# Altium project Interface-Board-v4.0.PrjPcb (part 1 of 2)
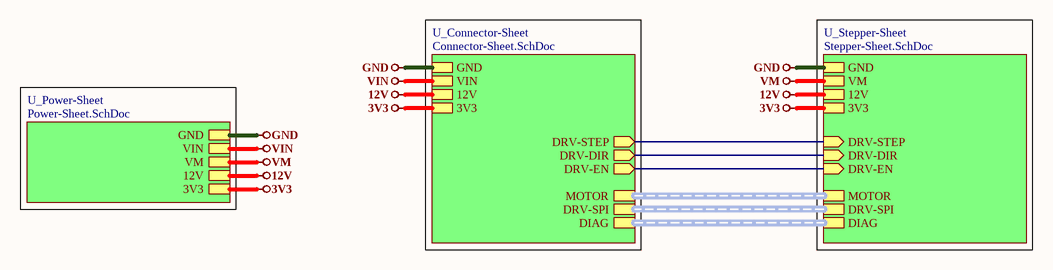
[diagram p0: Top-Sheet.SchDoc]
4 sheets, 98 parts. Net scope: hierarchical (ports join the sheet entries above them; power ports are global).
Board file: Interface-Board-v4.0.PcbDoc
Sheets:
  Top-Sheet.SchDoc
    U_Power-Sheet = Power-Sheet.SchDoc
    U_Stepper-Sheet = Stepper-Sheet.SchDoc
    U_Connector-Sheet = Connector-Sheet.SchDoc

## Sheet Top-Sheet.SchDoc
size A4; SheetNumber: 1; SheetTotal: 4

### Sub-sheets
U_Connector-Sheet = Connector-Sheet.SchDoc: GND, 3V3, 12V, VIN, MOTOR (harness MOTOR), DRV-SPI (harness DRV-SPI), DIAG (harness DIAG), DRV-STEP (out), DRV-DIR (out), DRV-EN (out)
U_Power-Sheet = Power-Sheet.SchDoc: GND, 3V3, 12V, VM, VIN
U_Stepper-Sheet = Stepper-Sheet.SchDoc: GND, 3V3, 12V, VM, MOTOR (harness MOTOR), DRV-SPI (harness DRV-SPI), DIAG (harness DIAG), DRV-STEP (in), DRV-DIR (in), DRV-EN (in)

### Nets
3V3: sheet U_Power-Sheet/3V3, sheet U_Stepper-Sheet/3V3, sheet U_Connector-Sheet/3V3
12V: sheet U_Power-Sheet/12V, sheet U_Stepper-Sheet/12V, sheet U_Connector-Sheet/12V
GND: sheet U_Power-Sheet/GND, sheet U_Stepper-Sheet/GND, sheet U_Connector-Sheet/GND
VIN: sheet U_Power-Sheet/VIN, sheet U_Connector-Sheet/VIN
VM: sheet U_Power-Sheet/VM, sheet U_Stepper-Sheet/VM
DRV-DIR: sheet U_Stepper-Sheet/DRV-DIR, sheet U_Connector-Sheet/DRV-DIR
DRV-EN: sheet U_Stepper-Sheet/DRV-EN, sheet U_Connector-Sheet/DRV-EN
DRV-STEP: sheet U_Stepper-Sheet/DRV-STEP, sheet U_Connector-Sheet/DRV-STEP

### Buses and harness runs
harness sheet U_Connector-Sheet/DIAG = sheet U_Stepper-Sheet/DIAG
harness sheet U_Connector-Sheet/DRV-SPI = sheet U_Stepper-Sheet/DRV-SPI
harness sheet U_Connector-Sheet/MOTOR = sheet U_Stepper-Sheet/MOTOR

### Notes on the sheet
- File:
- Title:
- Date:
- Page
- Num:
- Total:
- Drawn By: Huzaifa Ali

## Sheet Power-Sheet.SchDoc
size A4; SheetNumber: 2; SheetTotal: 4
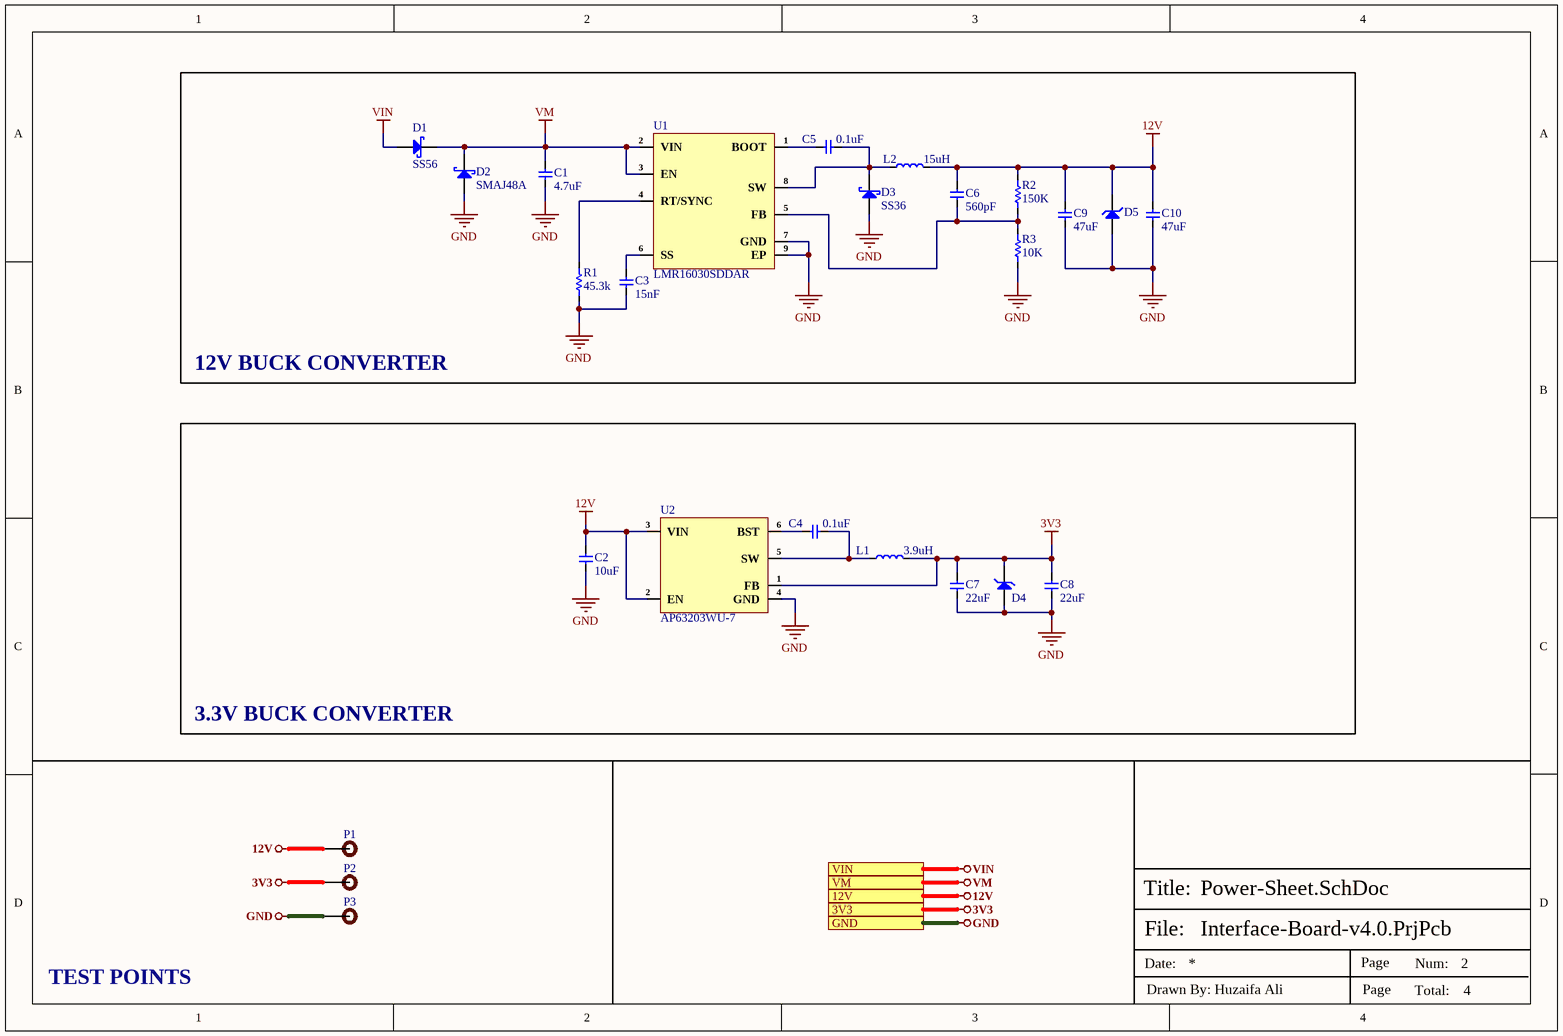
[diagram p1: Power-Sheet.SchDoc]

### Parts
C1  4.7uF  [Cap-1206]
C2  10uF  [Cap-0805]
C3  15nF  [Cap-0402]
C4  0.1uF  [Cap-0402]
C5  0.1uF  [Cap-0402]
C6  560pF  [Cap-0402]
C7  22uF  [Cap-0805]
C8  22uF  [Cap-0805]
C9  47uF  [Cap-1210]
C10  47uF  [Cap-1210]
D1  SS56  [SMA]
D2  SMAJ48A  [SMA]
D3  SS36  [SMA]
D4  MSP3V3HM3/89A  [MicroSMP]  (value not drawn)
D5  MSMP12A-M3/89A  [MicroSMP]  (value not drawn)
L1  3.9uH  [FNR4030S3R9MT]
L2  15uH  [FEXL0550A-150M]
P1  TEST POINT 0.5mm Dia  [Test-point - 0.5mm]  (value not drawn)
P2  TEST POINT 0.5mm Dia  [Test-point - 0.5mm]  (value not drawn)
P3  TEST POINT 0.5mm Dia  [Test-point - 0.5mm]  (value not drawn)
R1  45.3k  [Res-0402]
R2  150K  [Res-0402]
R3  10K  [Res-0402]
U1  LMR16030SDDAR  [8-SO-EP_]
U2  AP63203WU-7  [TSOT-23-6]

### Blocks framed on the sheet
12V BUCK CONVERTER: C1 C3 C5 C6 C9 C10 D1-D3 D5 L2 R1-R3 U1
3.3V BUCK CONVERTER: C2 C4 C7 C8 D4 L1 U2

### Ports
3V3 (see Top-Sheet[2B], Connector-Sheet[3D], Stepper-Sheet[3D]), 12V (see Top-Sheet[2B], Connector-Sheet[3D], Stepper-Sheet[3D]), GND (see Top-Sheet[2B], Connector-Sheet[3D], Stepper-Sheet[3D]), VIN (see Top-Sheet[2B], Connector-Sheet[3D]), VM (see Top-Sheet[2B], Stepper-Sheet[3D])

### Nets
3V3: C7.2 C8.2 D4.2(K) L1.2 P2.1 U2.1(FB) ; port 3V3
12V: C2.2 C6.2 C9.2 C10.2 D5.2(K) L2.2 P1.1 R2.2 U2.2(EN) U2.3(VIN) ; port 12V
GND: C1.1 C2.1 C3.1 C7.1 C8.1 C9.1 C10.1 D2.2(A) D3.2(A) D4.1(A) D5.1(A) P3.1 R1.1 R3.1 U1.7(GND) U1.9(EP) U2.4(GND) ; port GND
VIN: D1.2(A) ; port VIN
VM: C1.2 D1.1(K) D2.1(K) U1.2(VIN) U1.3(EN) ; port VM
NetC3_2: C3.2 U1.6(SS)
NetC4_1: C4.1 U2.6(BST)
NetC4_2: C4.2 L1.1 U2.5(SW)
NetC5_1: C5.1 U1.1(BOOT)
NetC5_2: C5.2 D3.1(K) L2.1 U1.8(SW)
NetC6_1: C6.1 R2.1 R3.2 U1.5(FB)
NetR1_2: R1.2 U1.4(RT/SYNC)

### Notes on the sheet
- TEST POINTS
- File:
- Title:
- Date:
- Page
- Num:
- Total:
- Drawn By: Huzaifa Ali

### Library data of the parts
C1 = GRM31CZ72A475KE11L: CAP CER, 4.7 uF, 100 V, ± 10%, X7R, 1206 [3216 Metric]; Manufacturer: Murata; Material: 4241ConductorMaterial; Voltage Rating: 100V; Item Type: Capacitor; Supplier: Digi-Key; Supplier Part Number: 490-GRM31CZ72A475KE11LCT-ND; Manufacturer Part Number: GRM31CZ72A475KE11L; RoHS: Yes; Category: Ceramic Capacitors; Stock: 152; Pricing: 1=0.76, 10=0.53, 50=0.4462, 100=0.3633, 500=0.30274, 1000=0.25495 (USD); Case/Package: 340Case; Min Operating Temperature: -55°C; Max Operating Temperature: 125°C; Value: 4.7uF; Tolerance: 10%; Length: 3.2mm; Width: 1.6mm; Height: 1.9mm; Thickness: 1.6mm; RoHS Compliant: Yes; LCSC Part Number: C2997285; ComponentLink1Description: LCSC; ComponentLink1URL: https://www.lcsc.com/product-detail/Multilayer-Ceramic-Capacitors-MLCC-SMD-SMT_Murata-Electronics-GRM31CZ72A475KE11L_C2997285.html
C2 = CL21B106KAYQNNE: 25V 10uF X7R ±10% 0805 Multilayer Ceramic Capacitors MLCC - SMD/SMT ROHS; Manufacturer: Samsung Electro-Mechanics; Manufacturer Part Number: CL21B106KAYQNNE; Package: 0805; LCSC Part Number: C3039694; Item Type: Capacitor; ComponentLink1Description: LCSC; ComponentLink1URL: https://www.lcsc.com/product-detail/Multilayer-Ceramic-Capacitors-MLCC-SMD-SMT_Samsung-Electro-Mechanics-CL21B106KAYQNNE_C3039694.html
C3 = CC0402KRX7R9BB153: CAP CER 0.015UF 50V X7R 0402; Manufacturer: Yageo; Tolerance: 10%; Item Type: Capacitor; Supplier: Future Electronics; Supplier Part Number: 1105976; Manufacturer Part Number: CC0402KRX7R9BB153; RoHS: Yes; Category: Ceramic Capacitors; Stock: 10000; Pricing: 10000=0.0032, 40000=0.0031, 150000=0.0029, 250000=0.0028, 500000=0.0027 (USD); Mounting Technology: Surface Mount; Case/Package: 0402; Min Operating Temperature: -55°C; Max Operating Temperature: 125°C; Packaging: Tape and Reel; Value: 15nF; Voltage Rating: 50V; Voltage Rating (DC): 50V; Dielectric: X7R; Series: CC; Length: 0.039inch; Width: 0.02inch; Thickness: 0.022inch; Lead Free: Lead Free; Halogen Free: Halogen Free; RoHS Compliant: Yes; ComponentLink1URL: https://datasheet.octopart.com/CC0402KRX7R9BB153-Yageo-datasheet-166511530.pdf?src-supplier=Future+Electronics; ComponentLink1Description: https://datasheet.octopart.com/CC0402KRX7R9BB153-Yageo-datasheet-166511530.pdf?src-supplier=Future+Electronics; ComponentLink2URL: https://datasheet.octopart.com/CC0402KRX7R9BB153-Yageo-datasheet-147453679.pdf?src-supplier=Newark; ComponentLink2Description: https://datasheet.octopart.com/CC0402KRX7R9BB153-Yageo-datasheet-147453679.pdf?src-supplier=Newark; ComponentLink3URL: http://www.yageo.com/documents/recent/UPY-GPHC_X7R_6.3V-to-50V_18.pdf?src-supplier=Digi-Key; ComponentLink3Description: http://www.yageo.com/documents/recent/UPY-GPHC_X7R_6.3V-to-50V_18.pdf?src-supplier=Digi-Key; ComponentLink4URL: https://www.yageo.com/upload/media/product/productsearch/datasheet/mlcc/UPY-GPHC_X7R_6.3V-to-50V_18.pdf?src-supplier=Digi-Key; ComponentLink4Description: https://www.yageo.com/upload/media/product/productsearch/datasheet/mlcc/UPY-GPHC_X7R_6.3V-to-50V_18.pdf?src-supplier=Digi-Key; ComponentLink5URL: https://datasheet.octopart.com/CC0402KRX7R9BB153-Yageo-datasheet-151948686.pdf?src-supplier=Farnell; ComponentLink5Description: https://datasheet.octopart.com/CC0402KRX7R9BB153-Yageo-datasheet-151948686.pdf?src-supplier=Farnell; ComponentLink6URL: http://www.yageo.com/exep/pages/download/literatures/ProductSelectionGuide%202014_Final_2.pdf?src-supplier=Digi-Key; ComponentLink6Description: http://www.yageo.com/exep/pages/download/literatures/ProductSelectionGuide%202014_Final_2.pdf?src-supplier=Digi-Key; LCSC Part Number: C114405
C4 C5 = CL05B104KB54PNC: CAP CER 0.1UF 50V X7R 0402; Manufacturer: Samsung; Supplier 1: Digi-Key; Manufacturer Part Number: CL05B104KB54PNC; Stock 1: 8594; Pricing 1: 1=0.1, 10=0.067, 50=0.0366, 100=0.0299, 500=0.02138, 1000=0.01681, 2500=0.01528, 5000=0.01406 (USD); Supplier Part Number 1: 1276-CL05B104KB54PNCDKR-ND; LCSC Part Number: C307331
C6 = CC0402JRX7R9BB561: CAP CER 560PF 50V X7R 0402; Manufacturer: Yageo; Tolerance: 5%; Item Type: Capacitor; Supplier: Future Electronics; Supplier Part Number: 5465612; Manufacturer Part Number: CC0402JRX7R9BB561; RoHS: Yes; Category: Ceramic Capacitors; Stock: 60000; Pricing: 10000=0.0037, 40000=0.0035, 100000=0.0033, 250000=0.0032, 400000=0.003 (USD); Mounting Technology: Surface Mount; Case/Package: 0402; Case Code (Imperial): 0402; Case Code (Metric): 1005; Min Operating Temperature: -55°C; Max Operating Temperature: 125°C; Packaging: Tape and Reel; Voltage Rating: 50V; Voltage Rating (DC): 50V; Value: 560pF; Dielectric: X7R; Termination: SMD/SMT; Series: CC; Construction: Flat; Length: 1mm; Width: 0.5mm; Height: 0.5mm; Thickness: 0.022inch; Depth: 0.5mm; Radiation Hardening: No; Lead Free: Lead Free; Halogen Free: Halogen Free; RoHS Compliant: Yes; ComponentLink1URL: https://datasheet.ciiva.com/26862/getdatasheetpartid-403463-26862618.pdf?src-supplier=Verical; ComponentLink1Description: https://datasheet.ciiva.com/26862/getdatasheetpartid-403463-26862618.pdf?src-supplier=Verical; ComponentLink2URL: https://datasheet.ciiva.com/11464/upy-gphc-x7r-6-3v-to-50v-8-11464855.pdf?src-supplier=Avnet; ComponentLink2Description: https://datasheet.ciiva.com/11464/upy-gphc-x7r-6-3v-to-50v-8-11464855.pdf?src-supplier=Avnet; ComponentLink3URL: https://datasheet.ciiva.com/13210/upy-gphc-x7r-6-3v-to-50v-8-12304-13210970.pdf?src-supplier=Mouser; ComponentLink3Description: https://datasheet.ciiva.com/13210/upy-gphc-x7r-6-3v-to-50v-8-12304-13210970.pdf?src-supplier=Mouser; LCSC Part Number: C541456
C7 C8 = GRM21BZ71A226ME15L: Multilayer Ceramic Capacitor, 22 uF, 10 V, ± 20%, X7R, 0805 [2012 Metric]; Manufacturer: Murata; Material: 4241ConductorMaterial; Voltage Rating: 10V; Supplier: Digi-Key; Supplier Part Number: 490-GRM21BZ71A226ME15LCT-ND; Manufacturer Part Number: GRM21BZ71A226ME15L; RoHS: Yes; Category: Ceramic Capacitors; Stock: 49126; Pricing: 1=0.39, 10=0.259, 50=0.191, 100=0.1556, 500=0.12282, 1000=0.10372 (USD); Package: 0805; Min Operating Temperature: -55°C; Max Operating Temperature: 125°C; Value: 22uF; Tolerance: 20%; Length: 2mm; Width: 1.25mm; Height: 1.45mm; Thickness: 1.25mm; ComponentLink1URL: https://datasheet.octopart.com/GRM21BZ71A226ME15L-Murata-datasheet-165579666.pdf?src-supplier=TME; ComponentLink1Description: https://datasheet.octopart.com/GRM21BZ71A226ME15L-Murata-datasheet-165579666.pdf?src-supplier=TME; LCSC Part Number: C907991; Item Type: Capacitor; ComponentLink2Description: LCSC; ComponentLink2URL: https://www.lcsc.com/product-detail/Multilayer-Ceramic-Capacitors-MLCC-SMD-SMT_Murata-Electronics-GRM21BZ71A226ME15L_C907991.html
C9 C10 = CS3225X7R476K160NRL: 16V 47uF X7R ±10% 1210 Multilayer Ceramic Capacitors MLCC - SMD/SMT ROHS; Manufacturer: Samwha Capacitor; Manufacturer part Number: CS3225X7R476K160NRL; Package: 1210; LCSC Part Number: C5440143; Item Type: Capacitor; ComponentLink1Description: LCSC; ComponentLink1URL: https://www.lcsc.com/product-detail/Multilayer-Ceramic-Capacitors-MLCC-SMD-SMT_Samwha-Capacitor-CS3225X7R476K160NRL_C5440143.html
D1 = SS56: DIODE SCHOTTKY 60V 5A SMA; Manufacturer: MDD; LCSC Par Number: C65009; Manufacturer Part Number: SS56; Iterm Type: Diode; ComponentLink1Description: LCSC; ComponentLink1URL: https://www.lcsc.com/product-detail/Schottky-Barrier-Diodes-SBD_MDD-Microdiode-Electronics-SS56_C65009.html
D2 = SMAJ48A: TVS DIODE 48VWM 77.4VC DO214AC; Manufacturer: Littelfuse; Polarity: Unidirectional; Breakdown Voltage: 53.3V; Peak Pulse Power: 400W; Reverse Standoff Voltage: 48V; Peak Pulse Current: 5.2A; Clamping Voltage: 77.4V; Number of Unidirectional Channels: 1; Power Line Protection: No; Test Current: 1mA; Diode Type: ZENER; Max Power Dissipation: 3.3W; Leakage Current: 1uA; Max Breakdown Voltage: 58.9V; Manufacturer Part Number: SMAJ48A; Package: SMA(DO-214AC); LCSC Part Number: C223991; Item Type: TVS  Diode; ComponentLink1Description: LCSC; Supplier: Rs; Supplier Part Number: 1719659; RoHS: Yes; Category: TVS Diodes; Stock: 2975; Pricing: 25=0.231, 100=0.214, 500=0.209, 1000=0.204 (GBP); Mounting Technology: Surface Mount; Case/Package: DO-214AC; Pins: 2; Min Operating Temperature: -65°C; Max Operating Temperature: 150°C; Min Breakdown Voltage: 53.3V; Packaging: Tape and Reel; Package Quantity: 5000; Max Surge Current: 5.2A; Series: SMAJ; Operating Supply Voltage: 48V; Direction: Unidirectional; Termination: SMD/SMT; Number of Channels: 1; Reverse Breakdown Voltage: 53.3V; Number of Elements: 1; Voltage Rating (DC): 48V; Power Dissipation: 400W; Clamping Voltage-Max: 77.4V; Length: 5.28mm; Width: 2.79mm; Height: 2.29mm; RoHS Compliant: Yes; Reach SVHC Compliant: No; Lead Free: Lead Free; ComponentLink2URL: https://datasheet.ciiva.com/28649/607617-28649159.pdf?src-supplier=Element14; ComponentLink2Description: https://datasheet.ciiva.com/28649/607617-28649159.pdf?src-supplier=Element14; ComponentLink3URL: https://datasheet.ciiva.com/16391/littelfuse-tvs-diode-smaj-16391798.pdf?src-supplier=Future+Electronics; ComponentLink3Description: https://datasheet.ciiva.com/16391/littelfuse-tvs-diode-smaj-16391798.pdf?src-supplier=Future+Electronics; ComponentLink4URL: https://datasheet.ciiva.com/330/littelfuse-tvs-diode-smaj-datasheet-pdf-330802.pdf?src-supplier=Digi-Key; ComponentLink4Description: https://datasheet.ciiva.com/330/littelfuse-tvs-diode-smaj-datasheet-pdf-330802.pdf?src-supplier=Digi-Key; ComponentLink5URL: https://datasheet.ciiva.com/330/littelfuse-tvs-diode-smaj-datasheet-pdf-330803.pdf?src-supplier=Digi-Key; ComponentLink5Description: https://datasheet.ciiva.com/330/littelfuse-tvs-diode-smaj-datasheet-pdf-330803.pdf?src-supplier=Digi-Key; ComponentLink6URL: https://datasheet.ciiva.com/330/littelfuse-tvs-diode-smaj-datasheet-pdf-330804.pdf?src-supplier=Digi-Key; ComponentLink6Description: https://datasheet.ciiva.com/330/littelfuse-tvs-diode-smaj-datasheet-pdf-330804.pdf?src-supplier=Digi-Key
D3 = SS36: Schottky Barrier Diode SK36, DO-214AB, 3A/60V; Manufacturer: ON Semiconductor / Fairchild; Output Current: 3A; Element Configuration: Single; Forward Voltage: 750mV; Max Repetitive Reverse Voltage (Vrrm): 60V; Max Forward Surge Current (Ifsm): 100A; Max Reverse Current: 500uA; Polarity: Standard; Power Dissipation: 2.27W; Supplier 1: Rs; Manufacturer Part Number: SS36; RoHS: Yes; Category: Schottky Diodes; Stock 1: 100; Pricing 1: 100=0.43800, 500=0.34200, 1000=0.27800, 3000=0.25000 (GBP); Mount: Surface Mount; Case/Package: SMC; Number of Pins: 2; Min Operating Temperature: -55°C; Max Operating Temperature: 150°C; Packaging: Tape and Reel; Package Quantity: 3000; Series: -; Forward Current: 3A; Peak Non-Repetitive Surge Current: 100A; Voltage Rating (DC): 60V; Current Rating: 3A; Max Surge Current: 100A; Average Rectified Current: 3A; Max Reverse Leakage Current: 500uA; Max Reverse Voltage (DC): 60V; Current: 3A; Voltage: 60V; Radiation Hardening: No; RoHS Compliant: Yes; Reach SVHC Compliant: Yes; Lead Free: Lead Free; ComponentLink1URL: https://datasheet.ciiva.com/4714/ss36-197193-4714610.pdf?src-supplier=Mouser; ComponentLink1Description: https://datasheet.ciiva.com/4714/ss36-197193-4714610.pdf?src-supplier=Mouser; ComponentLink2URL: https://datasheet.ciiva.com/16889/ss36-16889545.pdf?src-supplier=Future+Electronics; ComponentLink2Description: https://datasheet.ciiva.com/16889/ss36-16889545.pdf?src-supplier=Future+Electronics; ComponentLink3URL: https://datasheet.ciiva.com/920/ss34-920433.pdf?src-supplier=Digi-Key; ComponentLink3Description: https://datasheet.ciiva.com/920/ss34-920433.pdf?src-supplier=Digi-Key; ComponentLink4URL: https://datasheet.ciiva.com/920/ss34-920434.pdf?src-supplier=Digi-Key; ComponentLink4Description: https://datasheet.ciiva.com/920/ss34-920434.pdf?src-supplier=Digi-Key; ComponentLink5URL: https://datasheet.ciiva.com/920/ss34-920435.pdf?src-supplier=Digi-Key; ComponentLink5Description: https://datasheet.ciiva.com/920/ss34-920435.pdf?src-supplier=Digi-Key; Supplier Part Number 1: 9034425P; LCSC Part Number: C16015; Item Type: Diode
D4 = MSP3V3HM3/89A: TVS DIODE 3.3VWM 11.5VC MICROSMP; Direction: Unidirectional; Operating Supply Voltage: 3.3V; Max Surge Current: 75A; Breakdown Voltage: 4.1V; Clamping Voltage: 11V; Peak Pulse Power: 150W; Number of Unidirectional Channels: 1; Power Line Protection: No; Peak Pulse Current: 87A; Test Current: 1mA; Max Reverse Leakage Current: 200uA; Diode Type: ZENER; LCSC Part Number: C241899; Item Type: TVS Diode; ComponentLink1Description: LCSC; Supplier: Mouser; Supplier Part Number: 625-MSP3V3HM3; RoHS: Yes; Category: TVS Diodes; Stock: 15021; Pricing: 1=0.39, 10=0.313, 50=0.313, 100=0.165, 1000=0.068, 10000=0.05 (USD); Mounting Technology: Surface Mount; Min Operating Temperature: -55°C; Max Operating Temperature: 150°C; Packaging: Tape and Reel; Package Quantity: 4500; Polarity: Unidirectional; Reverse Standoff Voltage: 3.3V; Min Breakdown Voltage: 4.1V; Series: Automotive, AEC-Q101, TransZorb®, eSMP™; RoHS Compliant: Yes; ComponentLink2URL: https://datasheet.ciiva.com/14080/msp3v3-14080471.pdf?src-supplier=Digi-Key; ComponentLink2Description: https://datasheet.ciiva.com/14080/msp3v3-14080471.pdf?src-supplier=Digi-Key
D5 = MSMP12A-M3/89A: TVS DIODE 12VWM 19.9VC MICROSMP; Number of Unidirectional Channels: 1; Reverse Standoff Voltage: 12V; Min Breakdown Voltage: 13.3V; Peak Pulse Power: 150W; Power Line Protection: No; Peak Pulse Current: 7.5A; Diode Type: ZENER; LCSC Part Number: C1973858; Item Type: TVS Diode; ComponentLink1Description: LCSC; Supplier: Mouser; Supplier Part Number: 78-MSMP12A-M389A; RoHS: Yes; Category: TVS Diodes; Stock: 17037; Pricing: 1=0.36, 10=0.294, 50=0.294, 100=0.118, 1000=0.069, 10000=0.048 (USD); Mounting Technology: Surface Mount; Min Operating Temperature: -55°C; Max Operating Temperature: 150°C; Packaging: Tape and Reel; Series: TransZorb®; RoHS Compliant: Yes; ComponentLink2URL: http://www.vishay.com/docs/89457/mspm6a.pdf?src-supplier=Digi-Key; ComponentLink2Description: http://www.vishay.com/docs/89457/mspm6a.pdf?src-supplier=Digi-Key; ComponentLink3URL: http://www.vishay.com/docs/89457/msmp6athrumsmp20a.pdf?src-supplier=Digi-Key; ComponentLink3Description: http://www.vishay.com/docs/89457/msmp6athrumsmp20a.pdf?src-supplier=Digi-Key
L1 = FNR4030S3R9MT: 2.3A 3.9uH ±20% 3.3A SMD,4x4mm Power Inductors ROHS; Manufacturer: cjiang; Manufacturer Part Number: FNR4030S3R9MT; Footprint: Custom; ComponentLink1Description: LCSC; ComponentLink1URL: https://www.lcsc.com/product-detail/Power-Inductors_cjiang-Changjiang-Microelectronics-Tech-FNR4030S3R9MT_C167872.html; LCSC Part Number: C167872; Item Type: Inductor
L2 = FEXL0550A-150M: 3.9A 15uH Molding Choke ±20% 3.7A SMD,5.5x5.3mm Power Inductors ROHS; Manufacturer: cjiang; Manufacturer Part Number: FEXL0550A-150M; Package: SMD,5.5x5.3mm; LCSC Part Number: C5378518; Item Type: Inductor; ComponentLink1Description: LCSC; ComponentLink1URL: https://www.lcsc.com/product-detail/Power-Inductors_cjiang-Changjiang-Microelectronics-Tech-FEXL0550A-150M_C5378518.html
P1-P3 = TEST POINT 0.5mm Dia: Test Point ON; Item Type: Test Point
R1 = RT0402BRD0745K3L: RES SMD 45.3KOHM 0.1% 1/16W 0402; Manufacturer: Yageo; Value: 45.3kR; Power Rating: 62.5mW; Voltage Rating: 50V; Max Power Dissipation: 63mW; Temperature Coefficient: 25ppm/°C; Item Type: Resistor; Supplier: Future Electronics; Supplier Part Number: 4103245; Manufacturer Part Number: RT0402BRD0745K3L; RoHS: Yes; Category: Chip SMD Resistors; Stock: 10000; Pricing: 10000=0.0205, 20000=0.02, 30000=0.0197, 50000=0.0194, 100000=0.0187 (USD); Case/Package: 0402; Case Code (Imperial): 0402; Case Code (Metric): 1005; Weight: 2.3E-05oz; Min Operating Temperature: -55°C; Max Operating Temperature: 155°C; Packaging: Tape and Reel; Tolerance: 0.1%; Number of Terminations: 2; Termination: SMD/SMT; Voltage Rating (DC): 50V; Series: RT; Length: 1mm; Width: 0.5mm; Height: 0.3mm; Lead Free: Lead Free; RoHS Compliant: Yes; ComponentLink1URL: https://datasheet.ciiva.com/12796/pyu-rt-1-to-0-05-rohs-l-4-12796102.pdf?src-supplier=Mouser; ComponentLink1Description: https://datasheet.ciiva.com/12796/pyu-rt-1-to-0-05-rohs-l-4-12796102.pdf?src-supplier=Mouser; LCSC Part Number: C852795
R2 = RT0402BRD07150KL: RES 150K OHM 0.1% 1/16W 0402; Manufacturer: Yageo; Item Type: Resistor; Supplier: Future Electronics; Supplier Part Number: 3102901; Manufacturer Part Number: RT0402BRD07150KL; RoHS: Yes; Category: Chip SMD Resistors; Stock: 20000; Pricing: 10000=0.0218, 20000=0.0213, 30000=0.021, 50000=0.0206, 100000=0.0199 (USD); RoHS Compliant: Yes; LCSC Part Number: C852538
R3 = RT0402BRD0710KL: RES SMD 10K OHM 0.1% 1/16W 0402; Manufacturer: Yageo; Item Type: Resistor; Supplier: Future Electronics; Supplier Part Number: 1236728; Manufacturer Part Number: RT0402BRD0710KL; RoHS: Yes; Category: Chip SMD Resistors; Stock: 490000; Pricing: 10000=0.0218, 20000=0.0213, 30000=0.021, 50000=0.0206, 100000=0.0199 (USD); ComponentLink1URL: https://datasheet.ciiva.com/12836/pyu-rt-1-to-0-05-rohs-l-4-12836454.pdf?src-supplier=Mouser; ComponentLink1Description: https://datasheet.ciiva.com/12836/pyu-rt-1-to-0-05-rohs-l-4-12836454.pdf?src-supplier=Mouser; LCSC Part Number: C190095
U1 = LMR16030SDDAR: IC REG BUCK ADJUSTABLE 3A 8SOPWR; Manufacturer: Texas Instruments; Quiescent Current: 40uA; Supplier 1: Digi-Key; Manufacturer Part Number: LMR16030SDDAR; RoHS: Yes; Category: Voltage Regulators - Switching; Stock 1: 10434; Pricing 1: 1=4.08000, 10=3.66300, 25=3.46320, 100=3.00130, 250=2.84736, 500=2.55494, 1000=2.17800 (USD); Number of Pins: 8; Min Operating Temperature: -40°C; Max Operating Temperature: 125°C; Lead Free: Lead Free; RoHS Compliant: Yes; ComponentLink1URL: http://www.ti.com/lit/ds/symlink/lmr16030.pdf?src-supplier=Digi-Key; ComponentLink1Description: http://www.ti.com/lit/ds/symlink/lmr16030.pdf?src-supplier=Digi-Key; ComponentLink2URL: http://www.ti.com/general/docs/suppproductinfo.tsp?distId=10&amp;gotoUrl=http%3A%2F%2Fwww.ti.com%2Flit%2Fgpn%2Flmr16030&src-supplier=Digi-Key; ComponentLink2Description: http://www.ti.com/general/docs/suppproductinfo.tsp?distId=10&amp;gotoUrl=http%3A%2F%2Fwww.ti.com%2Flit%2Fgpn%2Flmr16030&src-supplier=Digi-Key; Supplier Part Number 1: 296-47797-1-ND; LCSC Part Number: C136648; Item Type: IC
U2 = AP63203WU-7: IC REG BUCK 3.3V 2A TSOT26; Manufacturer: Diodes; Supplier: Future Electronics; Supplier Part Number: 6109504; Manufacturer Part Number: AP63203WU-7; RoHS: Yes; Category: Voltage Regulators - Switching; Stock: 3000; Pricing: 3000=0.34, 6000=0.335, 9000=0.33, 12000=0.33, 15000=0.32 (USD); ComponentLink1URL: https://www.diodes.com/assets/Datasheets/AP63200-AP63201-AP63203-AP63205.pdf?src-supplier=Digi-Key; ComponentLink1Description: https://www.diodes.com/assets/Datasheets/AP63200-AP63201-AP63203-AP63205.pdf?src-supplier=Digi-Key; LCSC Part Number: C780769; Item Type: IC